# EAGLE design fuente_buck_50v-12v_10A_v1.2 (EAGLE 7.6.0)
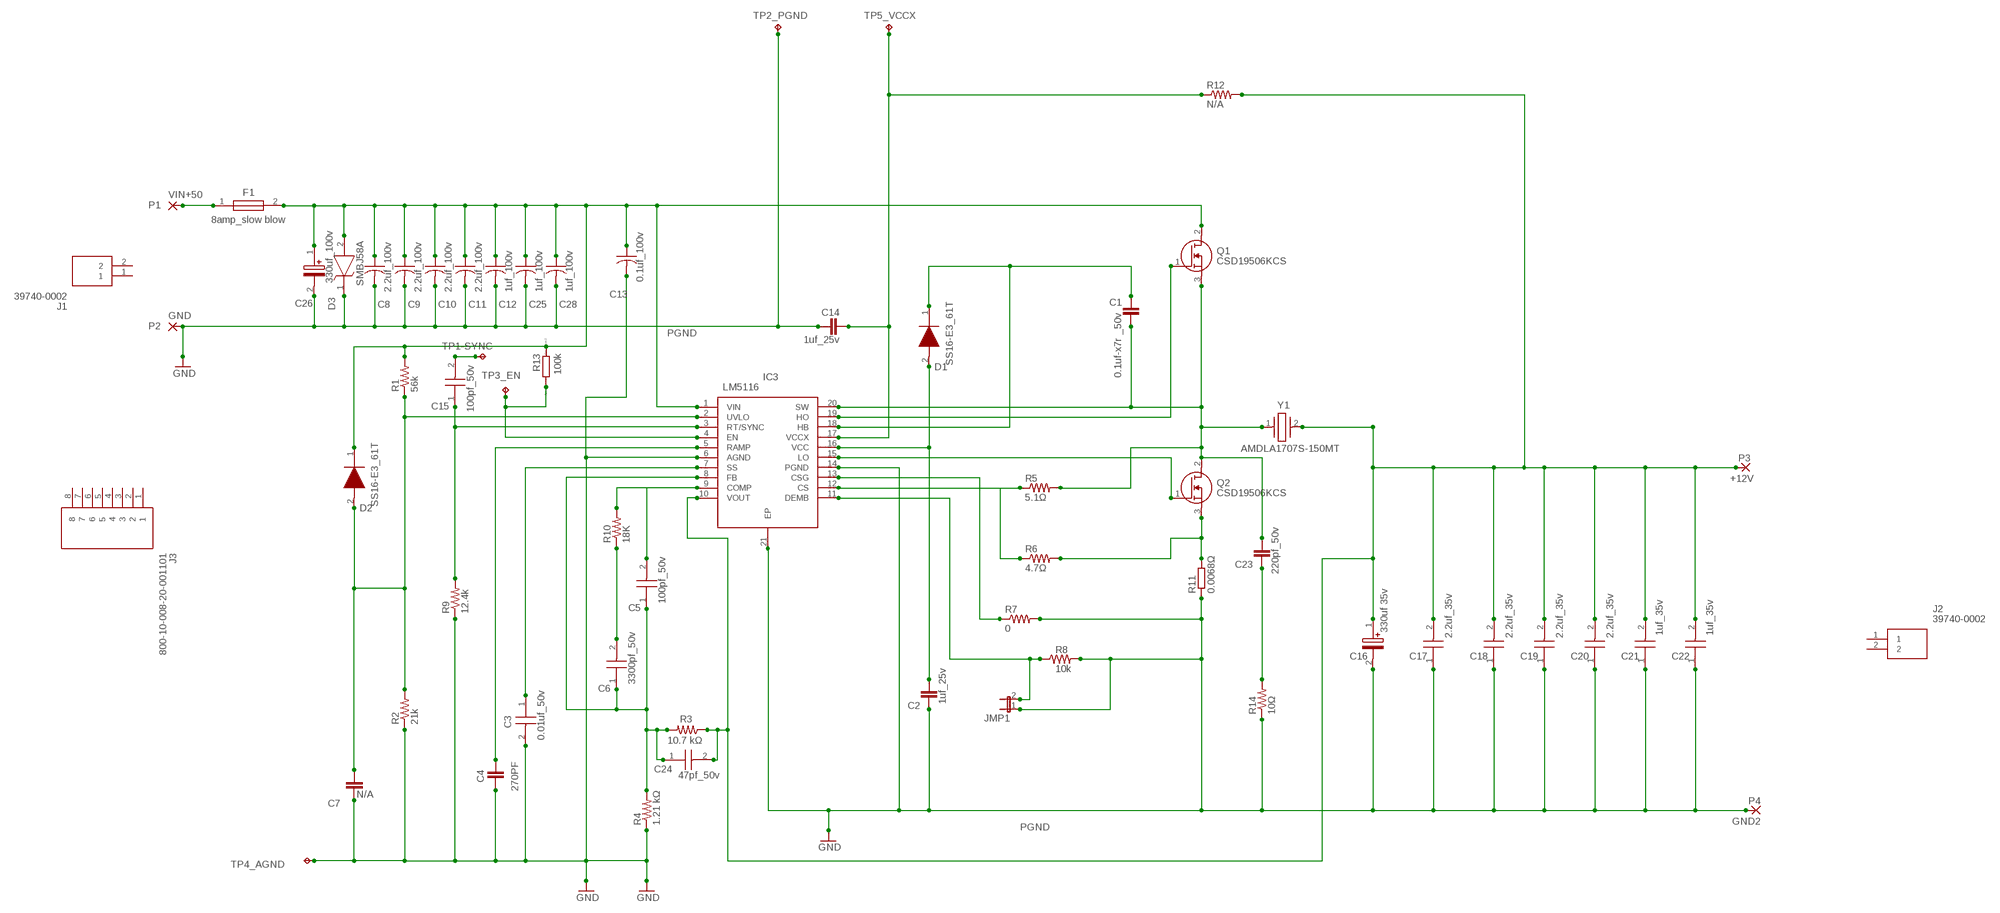
[diagram p0: schematic, sheet 1]

## Parts
+12V  P3  2,54/1,1  [2,54/1,1]
C1  0.1uf-x7r _50v  C-EUC0805  [C0805]
C2  1uf_25v  C-EUC0805  [C0805]
C3  0.01uf_50v  CGA3E2C0G1H221J080AD  [CAPC1608X90N]
C4  270PF  C-EUC0805  [C0805]
C5  100pf_50v  CGA3E2C0G1H221J080AD  [CAPC1608X90N]
C6  3300pf_50v  CGA3E2C0G1H221J080AD  [CAPC1608X90N]
C7  N/A  C-EUC0805  [C0805]
C8  2.2uf_100v  C-USC1206  [C1206]
C9  2.2uf_100v  C-USC1206  [C1206]
C10  2.2uf_100v  C-USC1206  [C1206]
C11  2.2uf_100v  C-USC1206  [C1206]
C12  1uf_100v  C-USC1206  [C1206]
C13  0.1uf_100v  C-USC1206  [C1206]
C14  1uf_25v  C-EUC0805  [C0805]
C15  100pf_50v  CGA3E2C0G1H221J080AD  [CAPC1608X90N]
C16  330uf 35v  EEEFK1V331P  [EEE0JA152UAP]
C17  2.2uf_35v  CL31B225KAHNNNE  [CAPC3216X180N]
C18  2.2uf_35v  CL31B225KAHNNNE  [CAPC3216X180N]
C19  2.2uf_35v  CL31B225KAHNNNE  [CAPC3216X180N]
C20  2.2uf_35v  CL31B225KAHNNNE  [CAPC3216X180N]
C21  1uf_35v  CL31B225KAHNNNE  [CAPC3216X180N]
C22  1uf_35v  CL31B225KAHNNNE  [CAPC3216X180N]
C23  220pf_50v  C-EUC0805  [C0805]
C24  47pf_50v  CGA3E2C0G1H221J080AD  [CAPC1608X90N]
C25  1uf_100v  C-USC1206  [C1206]
C26  330uf_100v  UCD2A331MNQ1MS  [CAPAE1910X1750N]
C28  1uf_100v  C-USC1206  [C1206]
D1  SS16-E3_61T  [DIOM5127X229N]
D2  SS16-E3_61T  [DIOM5127X229N]
D3  SMBJ58A  [DIOM5436X261N]
F1  8amp_slow blow  SF-1206S800W-2  [FUSC3216X123N]
GND  P2  2,54/1,1  [2,54/1,1]
GND2  P4  2,54/1,1  [2,54/1,1]
IC3  LM5116  LM5116MHX_NOPB  [SOP65P640X110-21N]
J1  39740-0002  [397400002]
J2  39740-0002  [397400002]
J3  800-10-008-20-001101  [HDRRA8W60P0X254_1X8_2032X295X2]
JMP1  JP1E  [JP1]
Q1  CSD19506KCS  [TO254P470X1016X1611-3P]
Q2  CSD19506KCS  [TO254P470X1016X1611-3P]
R1  56k  R-US_M0805  [M0805]
R2  21k  R-US_M0805  [M0805]
R3  10.7 kΩ  R-US_M0805  [M0805]
R4  1.21 kΩ  R-US_M0805  [M0805]
R5  5.1Ω  R-US_M0805  [M0805]
R6  4.7Ω  R-US_M0805  [M0805]
R7  0  R-US_M0805  [M0805]
R8  10k  R-US_M0805  [M0805]
R9  12.4k  R-US_M0805  [M0805]
R10  18K  R-US_M0805  [M0805]
R11  0.0068Ω  R-EU_R2512  [R2512]
R12  N/A  R-US_M0805  [M0805]
R13  100k  R  [R0805]
R14  10Ω  R-US_M0805  [M0805]
TP1-SYNC  TP1  TPPAD1-13  [P1-13]
TP2_PGND  TPPAD1-13  [P1-13]
TP3_EN  TPPAD1-13  [P1-13]
TP4_AGND  TPPAD1-13  [P1-13]
TP5_VCCX  TPPAD1-13  [P1-13]
VIN+50  P1  2,54/1,1  [2,54/1,1]
Y1  AMDLA1707S-150MT  [INDPM178169X700N]

## Nets
10K [power]: C2.1 D1.2(A) IC3.16(VCC)
GND [power]: C2.2 C3.2 C4.2 C7.2 C8.2 C9.2 C10.2 C11.2 C12.2 C13.2 C14.1 C16.2(-) C17.1 C18.1 C19.1 C20.1 C21.1 C22.1 C25.2 C26.2(-) C28.2 D3.1(K) GND2.1(P) GND.1(P) IC3.6(AGND) IC3.14(PGND) IC3.21(EP) JMP1.1 R2.1 R4.1 R7.2 R8.2 R9.1 R11.1 R14.1 TP2_PGND.TP TP4_AGND.TP
N$1: C5.1 C6.1 C24.1 IC3.8(FB) R3.2 R4.2
N$2: F1.1 VIN+50.1(P)
N$3: C23.2 R14.2
N$4: C7.1 D2.2(A) IC3.2(UVLO) R1.1 R2.2
N$5: C15.1 IC3.3(RT/SYNC) R9.2
N$6: C15.2 TP1-SYNC.TP
N$7: C4.1 IC3.5(RAMP)
N$8: C3.1 IC3.7(SS)
N$9: C14.2 IC3.17(VCCX) R12.1 TP5_VCCX.TP
N$10: C5.2 IC3.9(COMP) R10.2
N$11: IC3.19(HO) Q1.1(G)
N$12: C6.2 R10.1
N$14: +12V.1(P) C16.1(+) C17.2 C18.2 C19.2 C20.2 C21.2 C22.2 C24.2 IC3.10(VOUT) R3.1 R12.2 Y1.2
N$16: IC3.4(EN) R13.1 TP3_EN.TP
N$17: C1.1 C23.1 IC3.20(SW) Q1.3(S) Q2.2(D) R5.2 Y1.1
N$18: IC3.15(LO) Q2.1(G)
N$19: C1.2 D1.1(K) IC3.18(HB)
N$20: IC3.13(CSG) R7.1
N$21: Q2.3(S) R6.2 R11.2
N$23: IC3.11(DEMB) JMP1.2 R8.1
N$24: IC3.12(CS) R5.1 R6.1
VIN: C8.1 C9.1 C10.1 C11.1 C12.1 C13.1 C25.1 C26.1(+) C28.1 D2.1(K) D3.2(A) F1.2 IC3.1(VIN) Q1.2(D) R1.2 R13.2
Unconnected: J1.1 J1.2 J2.1 J2.2 J3.1 J3.2 J3.3 J3.4 J3.5 J3.6 J3.7 J3.8

## Notes on the sheet
- PGND
- PGND

## Library data of the parts
+12V GND GND2 VIN+50 = wirepad:2,54/1,1: THROUGH-HOLE PAD
C1 C2 C4 C7 C14 C23 = rcl:C-EU: CAPACITOR, European symbol
C3 C5 C6 C15 C24 = CGA3E2C0G1H221J080AD:CGA3E2C0G1H221J080AD: Multilayer Ceramic Capacitors MLCC - SMD/SMT EPXY 0603 50V, AEC-Q200, 220pF Source: Datasheet; DESCRIPTION: Multilayer Ceramic Capacitors MLCC - SMD/SMT EPXY 0603 50V, AEC-Q200, 220pF; HEIGHT: 0.9mm; MANUFACTURER_NAME: TDK; MANUFACTURER_PART_NUMBER: CGA3E2C0G1H221J080AD; MOUSER_PART_NUMBER: 810-CGA3E2C0G1H221JD; MOUSER_PRICE-STOCK: https://www.mouser.co.uk/ProductDetail/TDK/CGA3E2C0G1H221J080AD?qs=xLDY6iXSiQauXd%252Brvgz98g%3D%3D
C8-C13 C25 C28 = rcl:C-US: CAPACITOR, American symbol
C16 = EEEFK1V331P:EEEFK1V331P: SMD Aluminium Electrolytic Capacitor,Radial Can - SMD, 330 F, 35 V, FK Series, 2000 hours @ 105C Source: Datasheet <http://industrial.panasonic.com/cdbs/www-data/pdf/RDE0000/ABA0000C1181.pdf>; DESCRIPTION: SMD Aluminium Electrolytic Capacitor,Radial Can - SMD, 330 F, 35 V, FK Series, 2000 hours @ 105C; HEIGHT: 12mm; MANUFACTURER_NAME: Panasonic; MANUFACTURER_PART_NUMBER: EEEFK1V331P
C17-C22 = CL31B225KAHNNNE:CL31B225KAHNNNE: Samsung Electro-Mechanics 1206 CL 2.2uF Ceramic Multilayer Capacitor, 25 V, +125C, X7R Dielectric, +/-10% SMD Source: Datasheet <https://www.mouser.in/datasheet/2/585/MLCC-1837944.pdf>; DESCRIPTION: Samsung Electro-Mechanics 1206 CL 2.2uF Ceramic Multilayer Capacitor, 25 V, +125C, X7R Dielectric, +/-10% SMD; HEIGHT: 1.8mm; MANUFACTURER_NAME: SAMSUNG; MANUFACTURER_PART_NUMBER: CL31B225KAHNNNE
C26 = UCD2A331MNQ1MS:UCD2A331MNQ1MS: Nichicon 330F 100V dc Aluminium Electrolytic Capacitor, Surface Mount 18 (Dia.) x 16.5mm +105C 18mm Source: Datasheet <http://nichicon-us.com/english/products/pdfs/e-ucd.pdf>; DESCRIPTION: Nichicon 330F 100V dc Aluminium Electrolytic Capacitor, Surface Mount 18 (Dia.) x 16.5mm +105C 18mm; HEIGHT: 17.5mm; MANUFACTURER_NAME: Nichicon; MANUFACTURER_PART_NUMBER: UCD2A331MNQ1MS
D1 D2 = SS16-E3_61T:SS16-E3_61T: Vishay SS16-E3/61T, SMT Schottky Diode, 60V 1A, 2-Pin DO-214AC Source: Datasheet <https://componentsearchengine.com/Datasheets/2/SS16-E3_61T.pdf>; DESCRIPTION: Vishay SS16-E3/61T, SMT Schottky Diode, 60V 1A, 2-Pin DO-214AC; HEIGHT: 2.29mm; MANUFACTURER_NAME: Vishay; MANUFACTURER_PART_NUMBER: SS16-E3/61T; MOUSER_PART_NUMBER: 625-SS16-E3; MOUSER_PRICE-STOCK: https://www.mouser.co.uk/ProductDetail/Vishay-General-Semiconductor/SS16-E3-61T?qs=x2jpVgRnAtMiLlJLdPGu3w%3D%3D
D3 = SMBJ58A:SMBJ58A: Littelfuse SMBJ58A, Uni-Directional TVS Diode, 600W, 2-Pin DO-214AA Source: Datasheet <https://m.littelfuse.com/~/media/electronics/datasheets/tvs_diodes/littelfuse_tvs_diode_smbj_datasheet.pdf.pdf>; DESCRIPTION: Littelfuse SMBJ58A, Uni-Directional TVS Diode, 600W, 2-Pin DO-214AA; HEIGHT: 2.61mm; MANUFACTURER_NAME: LITTELFUSE; MANUFACTURER_PART_NUMBER: SMBJ58A
F1 = SF-1206S800W-2:SF-1206S800W-2: Surface Mount Fuses 8.0A Slow Blow 1206 SinglFuse Source: Datasheet <https://componentsearchengine.com/Datasheets/2/SF-1206S800W-2.pdf>; DESCRIPTION: Surface Mount Fuses 8.0A Slow Blow 1206 SinglFuse; HEIGHT: 1.23mm; MANUFACTURER_NAME: Bourns; MANUFACTURER_PART_NUMBER: SF-1206S800W-2; MOUSER_PART_NUMBER: 652-SF-1206S800W-2; MOUSER_PRICE-STOCK: https://www.mouser.co.uk/ProductDetail/Bourns/SF-1206S800W-2/?qs=fAHHVMwC%252BbhqdiwPMKxViA%3D%3D
IC3 = LM5116MHX_NOPB:LM5116MHX_NOPB: 6-100V Wide Vin, Current Mode Synchronous Buck Controller Source: Datasheet <http://www.ti.com/lit/gpn/lm5116>; DESCRIPTION: 6-100V Wide Vin, Current Mode Synchronous Buck Controller; HEIGHT: 1.1mm; MANUFACTURER_NAME: Texas Instruments; MANUFACTURER_PART_NUMBER: LM5116MHX/NOPB; MOUSER_PART_NUMBER: 926-LM5116MHX/NOPB; MOUSER_PRICE-STOCK: https://www.mouser.co.uk/ProductDetail/Texas-Instruments/LM5116MHX-NOPB?qs=QbsRYf82W3EaCl%2FW15P7yA%3D%3D
J1 J2 = 39740-0002:39740-0002: Pluggable Terminal Blocks EURO TERM BLK VERT 3.81MM 2C-GREEN Source: Datasheet <https://tools.molex.com/pdm_docs/sd/397400002_sd.pdf>; DESCRIPTION: Pluggable Terminal Blocks EURO TERM BLK VERT 3.81MM 2C-GREEN; HEIGHT: 8.9mm; MANUFACTURER_NAME: Molex; MANUFACTURER_PART_NUMBER: 39740-0002; MOUSER_PART_NUMBER: 538-39740-0002; MOUSER_PRICE-STOCK: https://www.mouser.co.uk/ProductDetail/Molex/39740-0002?qs=PVVDbbWpW3JCaIt2SPtzGA%3D%3D
J3 = 800-10-008-20-001101:800-10-008-20-001101: Connector Header Through Hole, Right Angle 8 position 0.100" (2.54mm) Source: Datasheet; DESCRIPTION: Connector Header Through Hole, Right Angle 8 position 0.100" (2.54mm); HEIGHT: 2.54mm; MANUFACTURER_NAME: Preci-Dip; MANUFACTURER_PART_NUMBER: 800-10-008-20-001101; MOUSER_PART_NUMBER: 437-8001000820001101; MOUSER_PRICE-STOCK: https://www.mouser.co.uk/ProductDetail/Preci-dip/800-10-008-20-001101?qs=yW1xe73lOtuI4rXyZThbGw%3D%3D
JMP1 = jumper:JP1E: JUMPER
Q1 Q2 = CSD19506KCS:CSD19506KCS: Texas Instruments CSD19506KCS N-channel MOSFET Transistor, 273 A, 80 V, 3-Pin TO-220 Source: Datasheet <http://www.ti.com/lit/gpn/csd19506kcs>; DESCRIPTION: Texas Instruments CSD19506KCS N-channel MOSFET Transistor, 273 A, 80 V, 3-Pin TO-220; HEIGHT: 4.7mm; MANUFACTURER_NAME: Texas Instruments; MANUFACTURER_PART_NUMBER: CSD19506KCS; MOUSER_PART_NUMBER: 595-CSD19506KCS; MOUSER_PRICE-STOCK: https://www.mouser.co.uk/ProductDetail/Texas-Instruments/CSD19506KCS?qs=8sOby8ZxZLGQrkLPFGWmvQ%3D%3D
R1-R10 R12 R14 = rcl:R-US_: RESISTOR, American symbol
R11 = resistor:R-EU_: RESISTOR, European symbol
R13 = eagle-ltspice:R: RESISTOR, European symbol; SPICEMODEL: NONE; SPICEPREFIX: R
TP1-SYNC TP2_PGND TP3_EN TP4_AGND TP5_VCCX = testpad:TP: Test pad
Y1 = AMDLA1707S-150MT:AMDLA1707S-150MT: 15 H Shielded Molded Inductor 16 A 15.5mOhm Max Nonstandard - Source: Datasheet <https://abracon.com/datasheets/AMDLA1707S.pdf>; DESCRIPTION: 15 H Shielded Molded Inductor 16 A 15.5mOhm Max Nonstandard -; HEIGHT: 7mm; MANUFACTURER_NAME: ABRACON; MANUFACTURER_PART_NUMBER: AMDLA1707S-150MT; MOUSER_PART_NUMBER: 815-AMDLA1707S-150MT; MOUSER_PRICE-STOCK: https://www.mouser.co.uk/ProductDetail/ABRACON/AMDLA1707S-150MT?qs=DPoM0jnrROXZdMVrsDE%2FmQ%3D%3D

## Net classes
0 default: width 0.152 mm, drill 0.305 mm, clearance 0.152 mm
1 power: width 0.127 mm, drill 0.305 mm, clearance 0.127 mm
2 thin: width 0.508 mm, drill 0.305 mm, clearance 0.152 mm

## Board
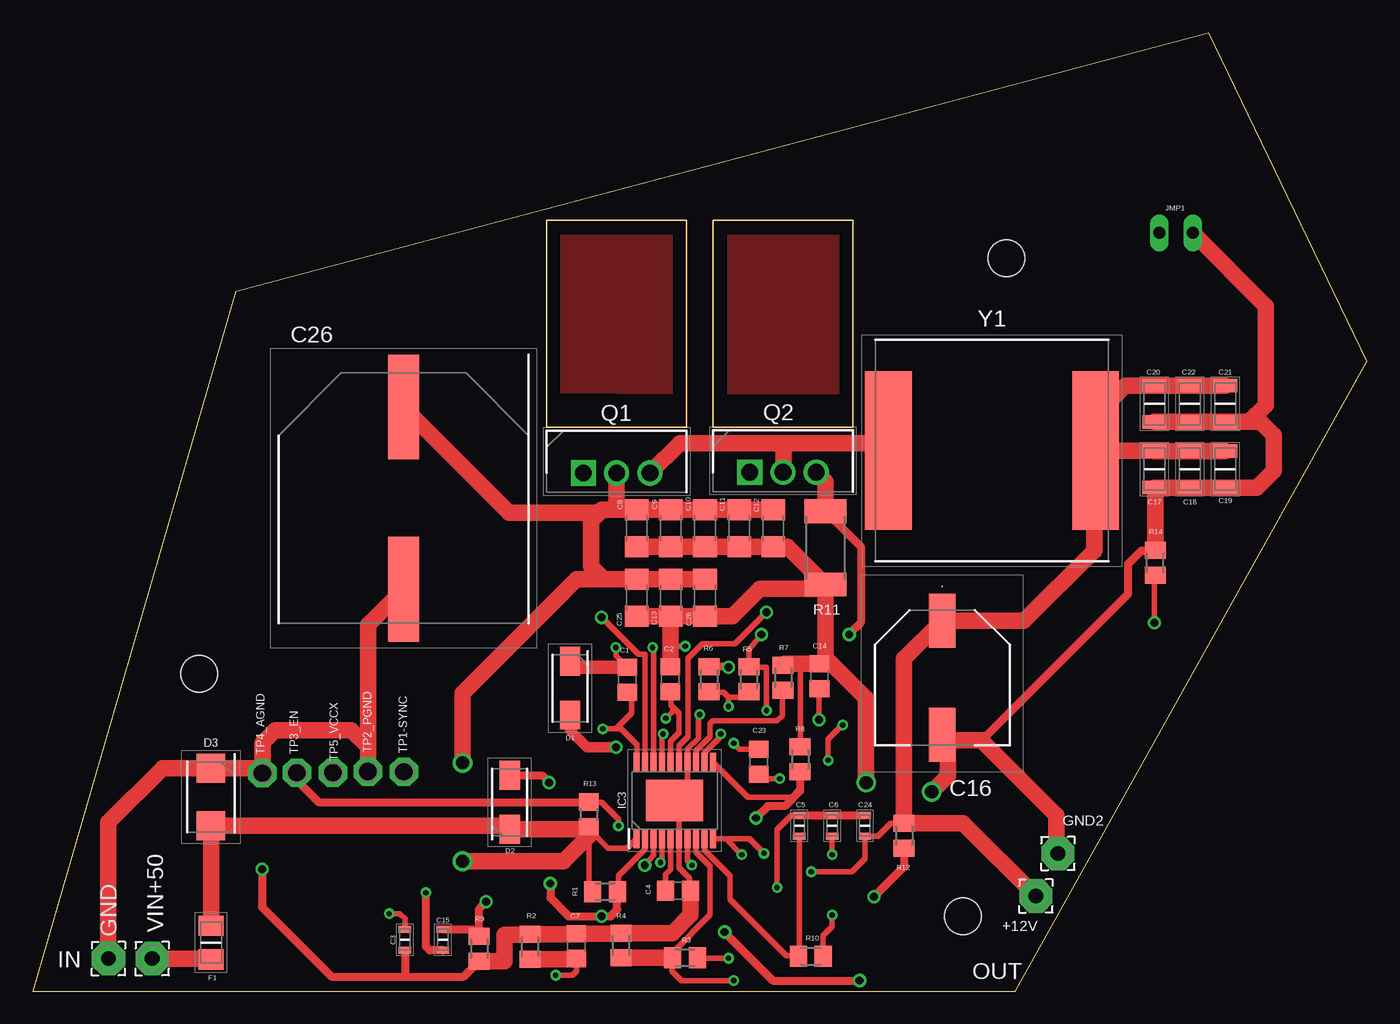
[diagram p1: board, top side]
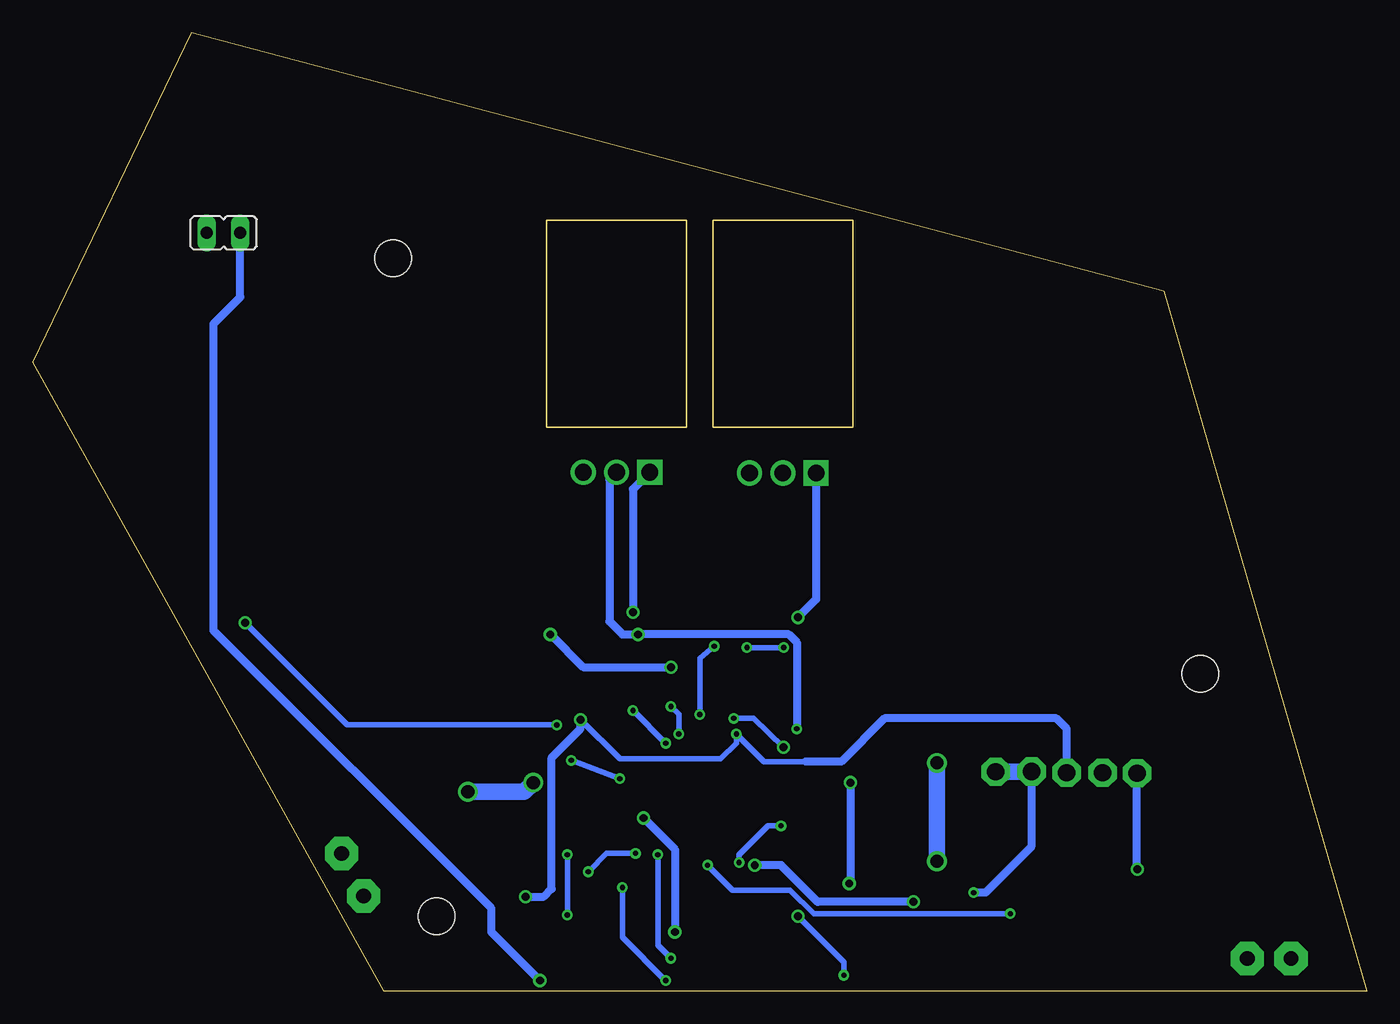
[diagram p2: board, bottom side, seen from below]

Size 101.8 x 73.1 mm. Coordinates in mm from the lower left corner, seen from the top.
Outline: 0,0 75,0 101.8,48 89.7,73.1 15.5,53.4 0,0
Outline: 39.2,43 39.2,58.8 49.9,58.8 49.9,43 39.2,43
Outline: 51.9,58.8 51.9,43 62.6,43 62.6,58.8 51.9,58.8
Copper layers (1*16): Top 0.035mm / dielectric 1.5mm / Bottom 0.035mm
Design rules "default": minimum track width 10mil, minimum drill 24mil, track to track 8mil, track to pad 8mil, pad to pad 8mil, via to via 8mil, smd to smd 8mil, copper to edge 40mil, drill to drill 8mil, minimum pad ring 10mil, minimum via ring 8mil, stop-mask expansion 4mil, vias tented up to drill 0mil, thermal gap 10mil
Holes 2.8 mm at 12.7,24.2 74.3,55.9 71,5.7

### Footprints (pad centres in the part's own frame; a part is rotated, then mirrored left to right if it is on the bottom)
2,54/1,1 = drill 1.118 pad 2.54 octagon: 1 0,0
C0805 = smd 1.3 x 1.5: 1 -0.95,0; 2 0.95,0
CAPC1608X90N = smd 0.54 x 0.94: 1 -0.8,0; 2 0.8,0
C1206 = smd 1.6 x 1.8: 1 -1.4,0; 2 1.4,0
EEE0JA152UAP = smd 4.1 x 2: 1 -4.35,0; 2 4.35,0
CAPC3216X180N = smd 1.05 x 1.82: 1 -1.39,0; 2 1.39,0
CAPAE1910X1750N = smd 8 x 2.4: 1 -6.95,0; 2 6.95,0
DIOM5127X229N = smd 2.2 x 1.55: 1 -2.05,0; 2 2.05,0
DIOM5436X261N = smd 2.2 x 2.15: 1 -2.2,0; 2 2.2,0
FUSC3216X123N = smd 1.55 x 1.91: 1 -1.285,0; 2 1.285,0
SOP65P640X110-21N = smd 1.45 x 0.45: 1 -2.925,2.925; 2 -2.925,2.275; 3 -2.925,1.625; 4 -2.925,0.975; 5 -2.925,0.325; 6 -2.925,-0.325; 7 -2.925,-0.975; 8 -2.925,-1.625; 9 -2.925,-2.275; 10 -2.925,-2.925; 11 2.925,-2.925; 12 2.925,-2.275; 13 2.925,-1.625; 14 2.925,-0.975; 15 2.925,-0.325; 16 2.925,0.325; 17 2.925,0.975; 18 2.925,1.625; 19 2.925,2.275; 20 2.925,2.925 | smd 3.15 x 4.35: 21 0,0
397400002 = drill 1.2 pad 1.8 square: 1 0,0 | drill 1.2 pad 1.8: 2 3.81,0
HDRRA8W60P0X254_1X8_2032X295X2 = drill 1.05 pad 1.575 square: 1 0,0 | drill 1.05 pad 1.575: 2 2.54,0; 3 5.08,0; 4 7.62,0; 5 10.16,0; 6 12.7,0; 7 15.24,0; 8 17.78,0
JP1 = drill 0.914 long: 1 0,-1.27; 2 0,1.27
TO254P470X1016X1611-3P = drill 1.28 pad 1.92 square: 1 0,0 | drill 1.28 pad 1.92: 2 2.54,0; 3 5.08,0
M0805 = smd 1.3 x 1.6: 1 -0.95,0; 2 0.95,0
R2512 = smd 1.8 x 3.2: 1 -2.8,0; 2 2.8,0
R0805 = smd 1.3 x 1.5: 1 -0.95,0; 2 0.95,0
P1-13 = drill 1.321 pad 2.159 octagon: TP 0,0
INDPM178169X700N = smd 3.55 x 12.1: 1 -7.9,0; 2 7.9,0

### Placement (x,y rotation side)
+12V  76.55,7.25 0 top
C1  45.36,23.75 90 top
C2  48.66,23.78 90 top
C3  28.4,3.9 270 top
C4  49.23,7.65 0 top
C5  58.5,12.6 270 top
C6  61,12.6 270 top
C7  41.49,3.43 90 top
C8  46.1,35.3 270 top
C9  48.7,35.3 270 top
C10  51.3,35.3 270 top
C11  53.9,35.3 270 top
C12  56.5,35.3 270 top
C13  48.7,30 270 top
C14  60.04,24.01 270 top
C15  31.3,3.9 270 top
C16  69.4,23.9 270 top
C17  85.6,39.8 90 top
C18  88.3,39.8 90 top
C19  91,39.8 90 top
C20  85.6,44.8 90 top
C21  88.3,44.8 90 top
C22  91,44.8 90 top
C23  55.4,17.5 270 top
C24  63.5,12.6 270 top
C25  46.1,30 270 top
C26  28.3,37.6 270 top
C28  51.3,30 270 top
D1  41,23.1 270 top
D2  36.4,14.4 90 top
D3  13.6,14.8 270 top
F1  13.6,3.7 90 top
GND  5.77,2.47 270 top
GND2  78.23,10.49 0 top
IC3  48.99,14.54 90 top
J1  186,49.5 270 top  (outside the outline)
J2  184.5,31.4 0 top  (outside the outline)
J3  190.2,17.3 180 top  (outside the outline)
JMP1  87.24,57.83 270 bottom
Q1  42.02,39.52 0 top
Q2  54.71,39.57 0 top
R1  43.67,7.59 180 top
R2  37.96,3.37 270 top
R3  49.77,2.55 180 top
R4  44.9,3.47 270 top
R5  54.65,23.79 90 top
R6  51.61,23.78 90 top
R7  57.26,23.91 90 top
R8  58.56,17.67 90 top
R9  34.07,3.23 90 top
R10  59.37,2.65 180 top
R11  60.5,33.8 90 top
R12  66.49,11.85 90 top
R13  42.44,13.47 270 top
R14  85.66,32.67 270 top
TP1-SYNC  28.33,16.73 0 top
TP2_PGND  25.58,16.75 0 top
TP3_EN  20.16,16.65 0 top
TP4_AGND  17.53,16.61 0 top
TP5_VCCX  22.9,16.65 0 top
VIN+50  9.11,2.47 0 top
Y1  73.2,41.22 0 top

### Tracks (layer width: path | path; a pad name or v marks a point on that pad's centre or on a via)
10K  (via drill 0.4, 0.6)
  Top 0.406: IC3.16 48.66,19.07 49.3,19.7 49.3,21.2 48.85,21.65 | 48.85,21.65 48.7,21.8 48.7,22.79 C2.1 | v48.3,20.8 48.85,21.35 48.85,21.65
  Top 0.813: D1.2 41,19.9 42.3,18.6 v44.5,18.6
  Bottom 0.406: v44.5,18.6 46.8,20.8 v48.3,20.8
GND  (via drill 0.4, 0.6, 1)
  Top 0.406: C4.2 50.1,7.73 50.1,8.6 49.31,9.38 IC3.6 49.31,14.21 IC3.21 49.97,15.52 IC3.14 49.97,18.46 50.8,19.3 50.8,21 v50.9,21.1 | C2.2 48.87,24.73 48.9,24.7 | v49.8,26.3 48.76,26.3 48.66,26.4 | R8.2 58.6,18.66 58.6,24.8 58.54,24.86 R7.2
  Top 0.61: v17.5,9.3 17.5,6.4 22.8,1.1 28.3,1.1 | 69.83,19.12 72.42,19.12 83.6,30.3 83.6,32.6 84.6,33.6 85.64,33.6 R14.1 | 28.3,1.1 32.89,1.1 R9.1 | C3.2 28.4,1.2 28.3,1.1
  Top 1.27: R9.1 36,2.28 36,4.3 37.96,4.3 R2.1 41.43,4.32 C7.2 44.9,4.38 R4.1 48.82,4.42 50.2,5.8 50.2,7.63 C4.2 | GND.1 5.77,12.87 9.9,17 D3.1 17.14,17 TP4_AGND.TP 17.53,18.93 18.5,19.9 24.3,19.9 25.58,18.62 | 69.83,19.12 C16.2 | TP2_PGND.TP 25.58,18.62 | C26.2 25.58,27.93 25.58,18.62 | C2.2 48.66,26.4 48.66,28.56 C13.2 | C25.2 C13.2 | C13.2 C28.2 53.4,28.6 55.5,30.7 60.2,30.7 R11.1 | R7.2 57.36,24.96 C14.1 60.5,25.42 | 60.5,25.42 R11.1 | 60.5,25.42 63.6,22.32 v63.6,15.9 | v68.6,15.2 69.83,16.43 69.83,19.12 | C20.1 C21.1 | C21.1 C22.1 93.69,43.41 94.7,42.4 94.7,39.7 93.4,38.4 C19.1 C18.1 C17.1 85.66,38.35 R14.1 | C21.1 92.81,43.41 94.1,44.7 94.1,52.24 JMP1.1 | C8.2 C9.2 C10.2 C11.2 C12.2 57.6,33.9 R11.1 | 69.83,19.12 72.38,19.12 78.1,13.4 78.1,10.62 GND2.1
  Bottom 0.406: v50.9,21.1 50.9,25.4 v49.8,26.3
  Bottom 0.61: v17.5,9.3 17.53,9.33 TP4_AGND.TP
  Bottom 1.27: v63.6,15.9 64.3,15.2 v68.6,15.2
N$1  (via drill 0.4)
  Top 0.406: IC3.8 50.62,10.59 51.7,9.5 51.7,5.8 48.82,2.92 R3.2 48.8,2.53 48.8,1.5 49.5,0.8 v53.5,0.8 | C5.1 57.9,13.4 56.8,12.3 v56.8,7.9
  Top 0.61: C5.1 C6.1 C24.1
  Top 1.27: R4.2 48.79,2.52 R3.2
  Bottom 0.406: v56.8,7.9 56.8,4.1 v53.5,0.8
N$2
  Top 1.27: VIN+50.1 13.54,2.47 F1.1
N$3  (via drill 0.4, 0.6)
  Top 0.406: C23.2 55.75,16.2 v57,16.2 | v60.7,17.6 60.7,19.2 v61.8,20.3 | v85.6,28.1 85.6,31.66 R14.2
  Bottom 0.406: v61.8,20.3 77.8,20.3 v85.6,28.1 | v57,16.2 v60.7,17.6
N$4  (via drill 0.4, 0.6)
  Top 0.406: R1.1 44.7,7.67 44.7,8.8 46.72,10.81 IC3.2 | 41.51,2.5 C7.1 41.5,1.5 41.2,1.2 v39.9,1.2
  Top 0.61: D2.2 38.85,16.45 v39.4,15.9 | v39.5,8.2 39.5,7.1 40.9,5.7 v43.4,5.7 44.1,5.7 44.6,6.2 44.6,7.57 R1.1
  Top 1.27: R2.2 41.43,2.42 C7.1
  Bottom 0.406: v43.4,5.7 39.9,2.2 v39.9,1.2
  Bottom 0.61: v39.4,15.9 39.4,8.3 v39.5,8.2
N$5  (via drill 0.6)
  Top 0.406: IC3.3 47.37,10.37 v46.7,9.6
  Top 0.61: C15.1 33.55,4.7 R9.2 34.07,6.27 v34.6,6.8
  Bottom 0.61: v34.6,6.8 41.9,6.8 44.7,9.6 v46.7,9.6
N$6  (via drill 0.4)
  Top 0.61: C15.2 30.3,3.1 30,3.4 v30,7.5
  Bottom 0.61: 30,7.6 v30,7.5 29.1,7.5 25.6,11 25.6,16.7
  Bottom 1.27: 25.6,16.7 25.63,16.73 TP1-SYNC.TP
N$7
  Top 0.406: IC3.5 48.66,9.27 48.3,8.9 48.3,7.67 C4.1
N$8  (via drill 0.4)
  Top 0.406: IC3.7 49.97,9.94 v50.3,9.6 | v27.2,5.9 28,5.9 28.4,5.5 C3.1
  Bottom 0.406: 50.2,9.6 v50.3,9.6 48.4,7.7 44,7.7 42.2,5.9 v27.2,5.9
N$9  (via drill 0.4, 0.6)
  Top 0.406: v60,20.7 60,23.02 C14.2 | IC3.17 48.02,19.52 v48.1,19.6
  Top 0.61: R12.1 66.49,9.49 v64.2,7.2
  Bottom 0.406: 42.8,17.5 46,17.5 v48.1,19.6 48.1,18.9 49.3,17.7 57,17.7 v60,20.7
  Bottom 0.61: TP5_VCCX.TP 22.9,20 23.7,20.8 36.8,20.8 40.1,17.5 42.8,17.5 | v64.2,7.2 62.8,7.2 62.2,7.8 62.2,17.8 60,20 v60,20.7
N$10
  Top 0.406: C5.2 58.5,2.73 R10.2 58.37,2.7 57.5,2.7 53.2,7 53.2,8.8 51.27,10.73 IC3.9
N$11  (via drill 0.6)
  Top 0.406: IC3.19 46.72,25.68 46.22,25.68 v43.4,28.5
  Bottom 0.61: Q1.1 42.02,29.88 v43.4,28.5
N$12  (via drill 0.4)
  Top 0.406: C6.2 v61,10.4 | v61,5.8 61,4.9 60.3,4.2 60.3,2.67 R10.1
  Bottom 0.406: v61,10.4 v61,5.8
N$13
  pour Top (isolate 0.8, no thermals): 39.2,58.8 49.9,58.8 50,45.7 39.2,45.8
N$14  (via drill 0.4)
  Top 0.406: v54.1,10.4 52.88,11.62 IC3.10 54.69,11.62 v55.8,10.5 | v53.1,2.5 50.77,2.5 R3.1 | v59.4,9.1 62.5,9.1 63.5,10.1 C24.2 64.5,11.8 65.5,12.8 R12.2
  Top 1.27: Y1.2 81,41.12 81,33.6 75.65,28.25 C16.1 66.49,25.34 R12.2 71,12.8 +12V.1 | Y1.2 85.57,41.22 C17.2 C18.2 C19.2 | C20.2 C21.2 C22.2 83.39,46.19 81.1,43.9 Y1.2
  Bottom 0.406: v54.1,10.4 54.1,3.5 v53.1,2.5 | v55.8,10.5 58,10.5 v59.4,9.1
N$15
  pour Top (isolate 0.8, no thermals): 51.9,45.7 51.9,58.8 62.6,58.8 62.6,45.7
N$16  (via drill 0.4)
  Top 0.406: IC3.4 48.02,9.81 v47.9,9.8 | v44.7,12.6 44.7,13.1 43.4,14.4 42.46,14.4 R13.1
  Top 0.61: TP3_EN.TP 20.16,16.04 21.8,14.4 42.42,14.4 R13.1
  Bottom 0.406: v44.7,12.6 45.7,12.6 47.9,10.4 v47.9,9.8
N$17  (via drill 0.4, 0.6)
  Top 0.406: 45.36,22.76 C1.1 | v55.6,27.2 54.65,26.05 R5.2 54.49,24.7 56,24.7 v56,21.4 | v43.5,20 44.5,20 | 44.5,20 45.7,21.2 45.7,22.39 45.72,22.41 | 44.5,20 44.9,20 46.1,18.8 46.1,17.5 IC3.20 | v53.5,18.9 53.95,18.45 C23.1
  Top 0.61: 45.36,22.76 45.72,22.41
  Top 1.27: Q1.3 49.38,41.8 57.3,41.8 | 57.3,41.8 65.2,41.8 65.3,41.7 Y1.1 | Q2.2 57.3,39.62 57.3,41.8
  Bottom 0.406: v53.5,18.9 v56,21.4
  Bottom 0.61: v43.5,20 43.5,26.6 44.1,27.2 v55.6,27.2 56.8,27.2 57.8,28.2 57.8,39.02 Q2.2
N$18  (via drill 0.6)
  Top 0.406: IC3.15 49.31,18.71 50,19.4 50,25.4 51.1,26.5 53.6,26.5 v56,28.9
  Bottom 0.61: Q2.1 56,38.28 v56,28.9
N$19  (via drill 0.4)
  Top 0.406: IC3.18 47.37,26.14 v47.3,26.2 | v44.5,26.2 44.5,25.56 C1.2
  Top 0.61: D1.1 41.45,24.7
  Top 1.016: 41.45,24.7 C1.2
  Bottom 0.406: v47.3,26.2 v44.5,26.2
N$20
  Top 0.406: 57.3,22.92 R7.1 57.2,22.9 57.2,21 56.8,20.6 51.9,20.6 51.7,20.4 51.7,19.4 50.62,18.32 IC3.13
N$21  (via drill 0.6)
  Top 0.61: R11.2 63.2,33.9 63.2,28.1 v62.3,27.2 | v53.1,24.7 53.07,24.73 R6.2
  Top 1.27: Q2.3 60.5,38.86 R11.2
  Bottom 0.61: v62.3,27.2 59.8,24.7 v53.1,24.7
N$23  (via drill 0.6)
  Top 0.406: IC3.11 54.58,14.8 57.9,14.8 58.56,15.46 R8.1
  Top 0.61: R8.1 58.56,15.26 57.4,14.1 56.1,14.1 v55.2,13.2 | v52.8,4.5 56.5,0.8 v63.1,0.8
  Bottom 0.61: v55.2,13.2 52.8,10.8 v52.8,4.5 | v63.1,0.8 66.8,4.5 66.8,6.3 88,27.5 88,50.9 85.97,52.93 JMP1.2
N$24  (via drill 0.4)
  Top 0.406: v53.1,21.7 53.1,22.4 | 53.1,22.4 52.7,22.8 51.64,22.8 R6.1 | IC3.12 51.27,18.16 52.5,19.4 v52.5,19.6 | R5.1 54.01,22.4 53.1,22.4
  Bottom 0.406: v53.1,21.7 52.5,21.1 v52.5,19.6
VIN  (via drill 1)
  Top 0.406: IC3.1 45.35,10.9 43.9,10.9 42.44,12.36 R13.2 42.44,7.87 R1.2
  Top 1.27: F1.2 D3.2 36.15,12.6 D2.1 42.27,12.35 R13.2 42.44,11.84 40.5,9.9 v32.8,9.9 | v32.8,17.4 32.8,22.7 41.5,31.4 43.6,31.4 | 43.6,31.4 C25.1 C13.1 C28.1 | C10.1 C9.1 C8.1 45.1,36.7 44.56,37.24 Q1.2 44.6,39.56 | C10.1 C11.1 C12.1 | C10.1 43.4,36.7 43.2,36.5 | 43.2,36.5 42.6,35.9 42.6,32.4 43.6,31.4 | C26.1 36.35,36.5 43.2,36.5
  Bottom 1.27: v32.8,9.9 v32.8,17.4

### Text on the board
tPlace: IN | OUT
tValues: K1_POWER SUPPLY / 12V DC-DC (48V → 12V / 10A) / MADE IN SPAIN